# EAGLE board Chronos_DaughterBoard (EAGLE 9.7.0)
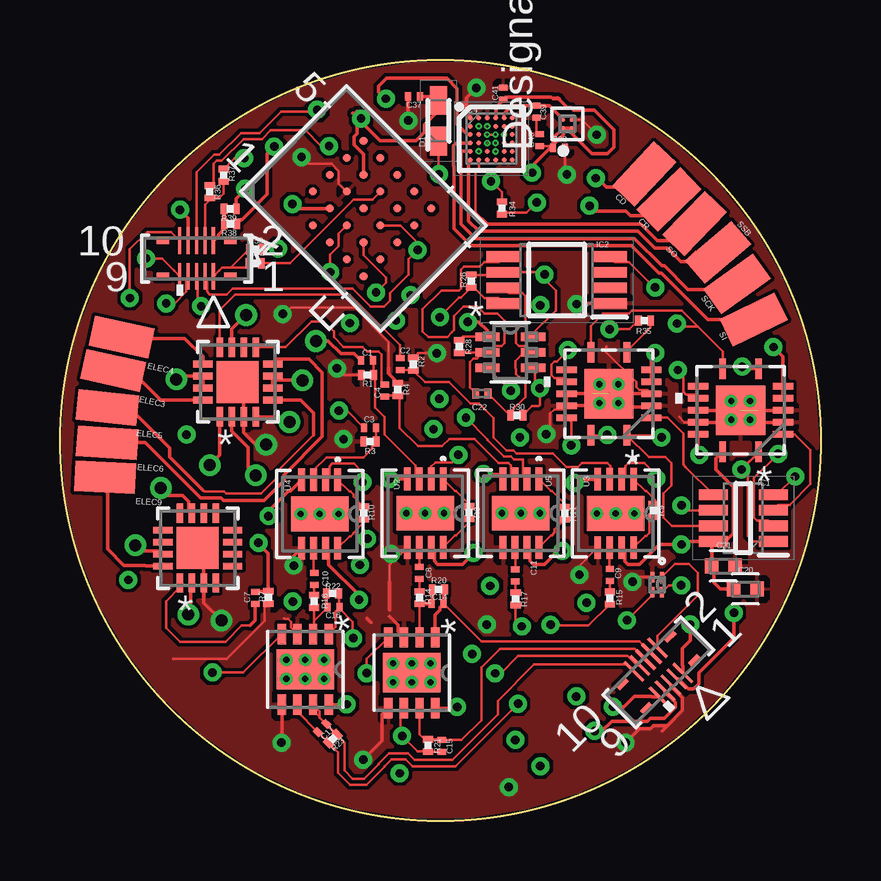
[diagram p5: board, top side]
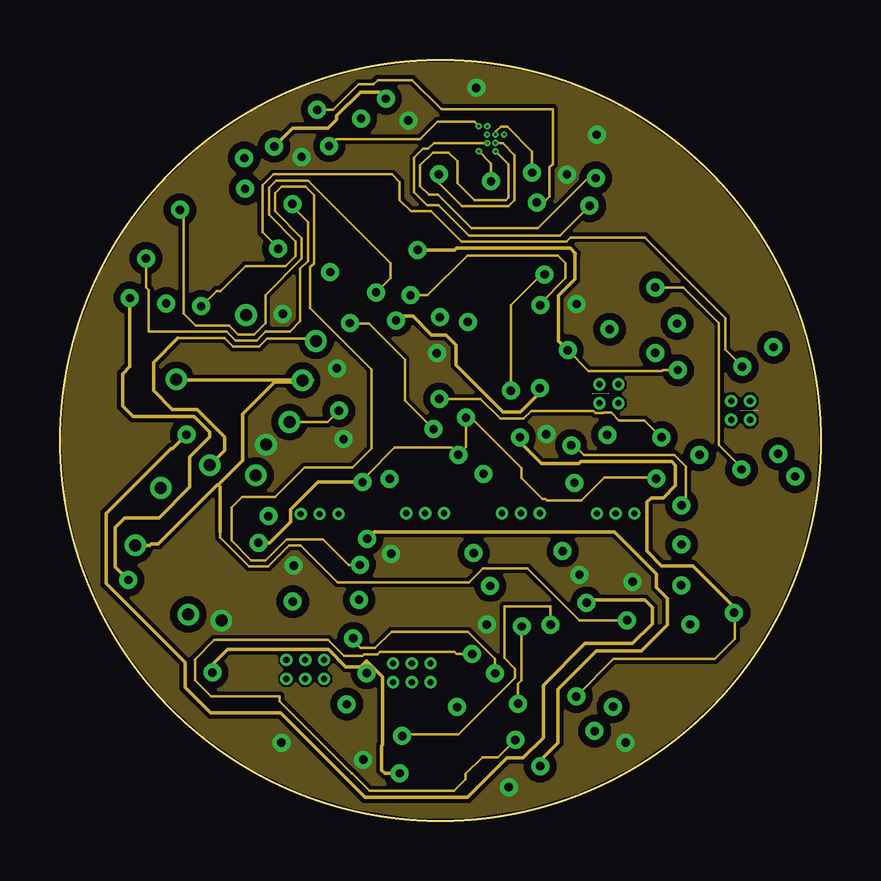
[diagram p6: board, inner layer Route2]
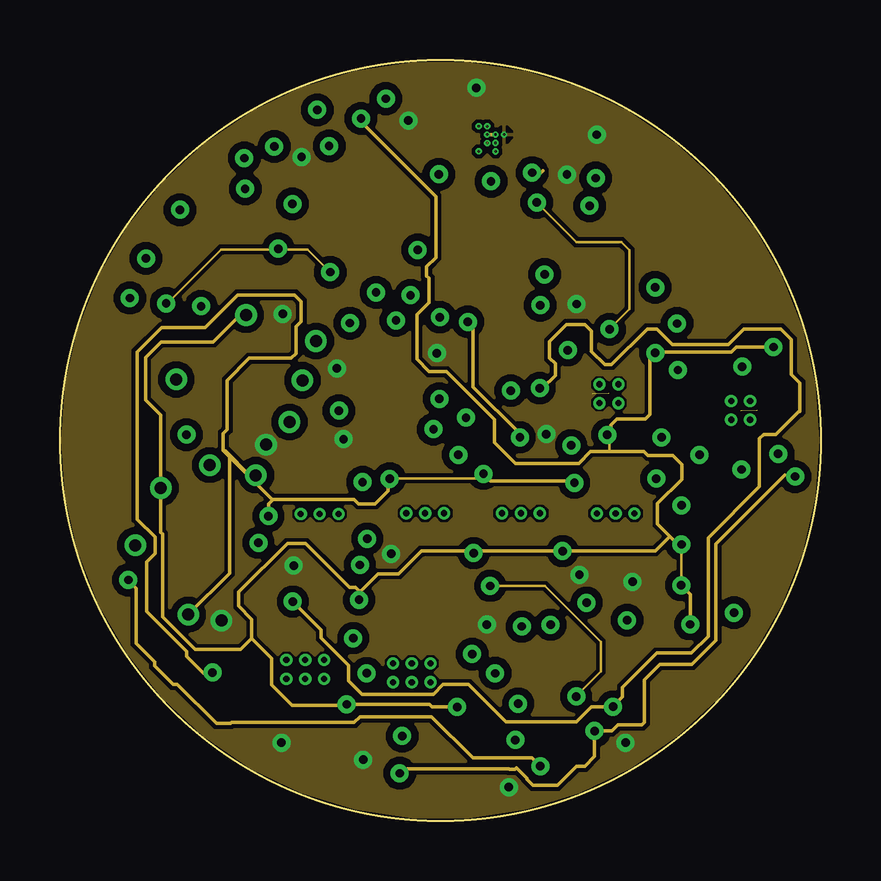
[diagram p7: board, inner layer Route15]
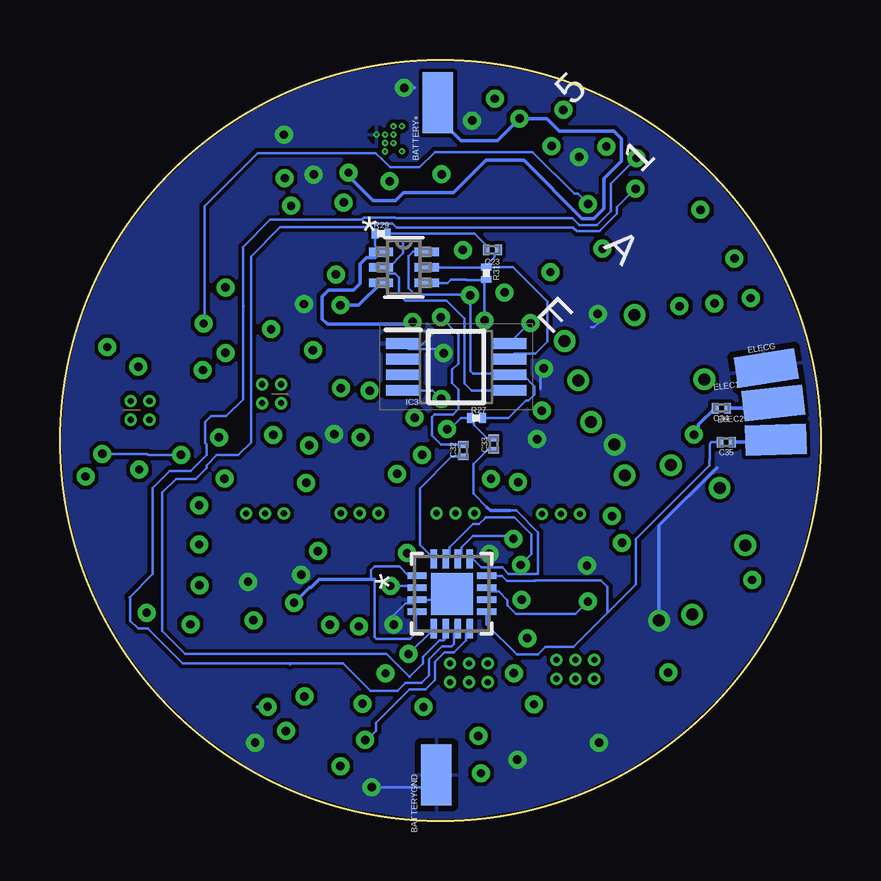
[diagram p8: board, bottom side, seen from below]

Size 31.71 x 31.71 mm. Coordinates in mm from the lower left corner, seen from the top.
Outline: circle at 15.86,15.86 radius 15.86
Copper layers (1+2*15+16): Top / Route2 / Route15 / Bottom
Stack-up 4 Layer Stack: Top SilkScreen Epoxy Ink / Top SolderMask SR:Green 0.0254mm Dk 4.3 / Top Surface Finish Lead-Free 0.02mm / Top CuFoil:007 0.035mm / Dielectric-1 Prepreg:001 0.064mm / Dielectric-2 Prepreg:001 0.064mm / Route2 CuFoil:007 0.035mm / Dielectric-3 Core:066 0.711mm / Route15 CuFoil:007 0.035mm / Dielectric-4 Prepreg:001 0.064mm / Dielectric-5 Prepreg:001 0.064mm / Bottom CuFoil:007 0.035mm / Bottom Surface Finish Lead-Free 0.02mm / Bottom SolderMask SR:Green 0.0254mm Dk 4.3 / Bottom SilkScreen Epoxy Ink
Design rules: minimum copper width 0.05mm, minimum drill size 0.35mm, copper clearance wire_polygon to wire_polygon 6mil, copper clearance wire_polygon to pad_smd 6mil, copper clearance wire_polygon to via 6mil, copper clearance pad_smd to pad_smd 6mil, copper clearance pad_smd to via 6mil, copper clearance via to via 6mil, copper clearance smd to pad (same net) 6mil, copper clearance smd to via (same net) 6mil, copper clearance smd to smd (same net) 6mil, dimension clearance 0.01mm, via restrict clearance 0mil, restrict clearance 0mil, drill distance 6mil, keepout clearance 0mil

## Footprints (pad centres in the part's own frame; a part is rotated, then mirrored left to right if it is on the bottom)
SMD1,27-2,54 = smd 1.27 x 2.54: 1 0,0
C0201 = smd 0.25 x 0.35: 1 -0.25,0; 2 0.25,0
CAPC1005X60 = smd 0.56 x 0.629: 1 -0.485,0; 2 0.485,0
RESC0201_L = smd 0.28 x 0.43: 1 -0.255,0; 2 0.255,0
DIOM179X85N = smd 1.2 x 0.7: 1 -0.85,0; 2 0.85,0
SOT65P280X145-8N = smd 1.2 x 0.45: 1 -1.25,0.975; 2 -1.25,0.325; 3 -1.25,-0.325; 4 -1.25,-0.975; 5 1.25,-0.975; 6 1.25,-0.325; 7 1.25,0.325; 8 1.25,0.975
SOP65P490X110-8N = smd 1.425 x 0.45: 1 -2.212,0.975; 2 -2.212,0.325; 3 -2.212,-0.325; 4 -2.212,-0.975; 5 2.212,-0.975; 6 2.212,-0.325; 7 2.212,0.325; 8 2.212,0.975
BGA36C35P6X6_208X208X49 = smd 0.215 x 0.215: A1 -0.875,0.875; A2 -0.525,0.875; A3 -0.175,0.875; A4 0.175,0.875; A5 0.525,0.875; A6 0.875,0.875; B1 -0.875,0.525; B2 -0.525,0.525; B3 -0.175,0.525; B4 0.175,0.525; B5 0.525,0.525; B6 0.875,0.525; C1 -0.875,0.175; C2 -0.525,0.175; C3 -0.175,0.175; C4 0.175,0.175; C5 0.525,0.175; C6 0.875,0.175; D1 -0.875,-0.175; D2 -0.525,-0.175; D3 -0.175,-0.175; D4 0.175,-0.175; D5 0.525,-0.175; D6 0.875,-0.175; E1 -0.875,-0.525; E2 -0.525,-0.525; E3 -0.175,-0.525; E4 0.175,-0.525; E5 0.525,-0.525; E6 0.875,-0.525; F1 -0.875,-0.875; F2 -0.525,-0.875; F3 -0.175,-0.875; F4 0.175,-0.875; F5 0.525,-0.875; F6 0.875,-0.875 | drill 0.1 pad 0.254: P$1 -0.528,0.525; P$2 -0.175,0.522; P$3 -0.177,0.175; P$4 0.171,0.176; P$5 0.527,0.174; P$6 -0.172,-0.174; P$7 0.171,-0.173; P$8 -0.528,-0.523; P$9 0.173,-0.526
CONN10_HIR = smd 0.127 x 1.118: 1 0.7,-0.747; 2 0.7,0.747; 3 0.35,-0.747; 4 0.35,0.747; 5 0,-0.747; 6 0,0.747; 7 -0.35,-0.747; 8 -0.35,0.747; 9 -0.7,-0.747; 10 -0.7,0.747 | smd 0.533 x 0.305: 11 -1.405,0.745; 12 1.405,0.745; 13 -1.405,-0.745; 14 1.405,-0.745
R0201 = smd 0.28 x 0.43: 1 -0.255,0; 2 0.255,0
FBGA24_8X6X1P2_FAB024_INF = smd 0.33 x 0.33: A2 -1,2; A3 0,2; A4 1,2; A5 2,2; B1 -2,1; B2 -1,1; B3 0,1; B4 1,1; B5 2,1; C1 -2,0; C2 -1,0; C3 0,0; C4 1,0; C5 2,0; D1 -2,-1; D2 -1,-1; D3 0,-1; D4 1,-1; D5 2,-1; E1 -2,-2; E2 -1,-2; E3 0,-2; E4 1,-2; E5 2,-2
DRG8_2P4X1P45 = smd 0.95 x 0.28: 1 -1.425,0.75; 2 -1.425,0.25; 3 -1.425,-0.25; 4 -1.425,-0.75; 5 1.425,-0.75; 6 1.425,-0.25; 7 1.425,0.25; 8 1.425,0.75 | smd 1.45 x 2.4: 9 0,0 | drill 0.254 pad 0.508: V 0,-0.787; V_1 0,0; V_2 0,0.787
CP_16_22_ADI = smd 0.275 x 0.805: 1 0.75,1.452; 2 0.25,1.452; 3 -0.25,1.452; 4 -0.75,1.452; 9 -0.75,-1.452; 10 -0.25,-1.452; 11 0.25,-1.452; 12 0.75,-1.452 | smd 0.805 x 0.275: 5 -1.452,0.75; 6 -1.452,0.25; 7 -1.452,-0.25; 8 -1.452,-0.75; 13 1.452,-0.75; 14 1.452,-0.25; 15 1.452,0.25; 16 1.452,0.75 | smd 1.75 x 1.75: HTAB 0,0
DRB8_2P4X1P65 = smd 0.85 x 0.35: 1 -1.475,0.975; 2 -1.475,0.325; 3 -1.475,-0.325; 4 -1.475,-0.975; 5 1.475,-0.975; 6 1.475,-0.325; 7 1.475,0.325; 8 1.475,0.975 | smd 1.65 x 2.4: 9 0,0 | drill 0.254 pad 0.508: V -0.394,-0.787; V_1 -0.394,0; V_2 -0.394,0.787; V_3 0.394,-0.787; V_4 0.394,0; V_5 0.394,0.787
X2SON4XP6XP6_NEX-L = smd 0.432 x 0.152: 1 -0.318,0.2; 2 -0.318,-0.2; 3 0.318,-0.2; 4 0.318,0.2
YCH0004A-IPC_A = smd 0.174 x 0.174: 1 -0.175,0.175; 2 0.175,0.175; 3 -0.175,-0.175; 4 0.175,-0.175
RGY14_2P05X2P05 = smd 0.28 x 0.85: 1 -0.75,1.731; 7 -0.75,-1.731; 8 0.75,-1.731; 14 0.75,1.731 | smd 0.85 x 0.28: 2 -1.769,1; 3 -1.769,0.5; 4 -1.769,0; 5 -1.769,-0.5; 6 -1.769,-1; 9 1.769,-1; 10 1.769,-0.5; 11 1.769,0; 12 1.769,0.5; 13 1.769,1 | smd 2.05 x 2.05: 15 0,0 | drill 0.254 pad 0.508: V -0.394,-0.394; V_1 -0.394,0.394; V_2 0.394,-0.394; V_3 0.394,0.394
SOT-363-6_2P2X1P35_ONS = smd 1.016 x 0.356: 1 -0.953,0.65; 2 -0.953,0; 3 -0.953,-0.65; 4 0.953,-0.65; 5 0.953,0; 6 0.953,0.65

## Placement (x,y rotation side)
BATTERY+  [SMD1,27-2,54]  15.96,29.93 0 bottom
BATTERYGND  [SMD1,27-2,54]  16.02,1.91 0 bottom
C1  470n  [C0201]  12.8,19.19 0 top
C2  470n  [C0201]  14.19,19.03 270 top
C3  470n  [C0201]  12.93,16.38 0 top
C4  470n  [C0201]  13.54,17.92 270 top
C7  [C0201]  8.14,9.28 90 top
C8  1u  [C0201]  14.99,10.34 270 top
C9  1u  [C0201]  22.93,10.24 270 top
C10  1u  [C0201]  10.6,10.09 270 top
C11  1u  [C0201]  18.99,10.22 270 top
C14  56p  [C0201]  15.75,9.05 0 top
C15  56p  [C0201]  15.92,3.12 270 top
C16  56p  [C0201]  11.42,8.9 180 top
C17  56p  [C0201]  10.93,3.87 225 top
C20  1u  [CAPC1005X60]  28.58,9.66 0 top
C21  0.1u  [CAPC1005X60]  27.66,10.62 0 top
C22  10u  [RESC0201_L]  17.59,17.81 180 top
C23  10u  [RESC0201_L]  13.69,23.8 180 bottom
C32  10u  [RESC0201_L]  14.9,15.43 90 bottom
C33  10u  [RESC0201_L]  13.63,15.7 90 bottom
C34  10u  [RESC0201_L]  4.14,17.2 180 bottom
C35  10u  [RESC0201_L]  3.94,15.78 180 bottom
C37  0.1u  [C0201]  14.76,30.19 180 top
C38  1u  [C0201]  20.81,28.05 0 top
C39  1u  [C0201]  19.87,29.56 270 top
C40  0.1u  [C0201]  20.01,28.37 90 top
C41  10u  [C0201]  18.48,30.31 90 top
CD  WIREPADSMD1,27-254  [SMD1,27-2,54]  24.36,26.96 316.7 top
CR  WIREPADSMD1,27-254  [SMD1,27-2,54]  25.39,25.9 314.1 top
D1  CDSU4148  [DIOM179X85N]  15.78,29.18 90 top
ELEC1  [SMD1,27-2,54]  1.98,17.42 276.4 bottom
ELEC2  [SMD1,27-2,54]  1.87,15.88 271.8 bottom
ELEC3  [SMD1,27-2,54]  2.23,18.77 77.5 top
ELEC4  [SMD1,27-2,54]  2.57,20.16 77.7 top
ELEC5  [SMD1,27-2,54]  1.98,17.23 83.9 top
ELEC6  [SMD1,27-2,54]  1.98,15.75 86.1 top
ELEC9  [SMD1,27-2,54]  1.88,14.31 87.2 top
ELECG  [SMD1,27-2,54]  2.27,18.87 279 bottom
IC1  OPA2369AIDCNR  [SOT65P280X145-8N]  28.49,12.62 180 top
IC2  LT1990IMS8-10#PBF  [SOP65P490X110-8N]  20.71,22.54 180 top
IC3  LT1990IMS8-10#PBF  [SOP65P490X110-8N]  15.2,18.92 0 bottom
IC4  ICE5LP4K-SWG36ITR1K  [BGA36C35P6X6_208X208X49]  17.99,28.43 0 top
J1  BM28B0.6-10DS/2-0.35V(51)CONN10_HIR  [CONN10_HIR]  24.95,6.19 45 top
J2  BM28B0.6-10DS/2-0.35V(51)CONN10_HIR  [CONN10_HIR]  5.7,23.44 0 top
R1  100k  [R0201]  12.82,18.58 0 top
R2  100k  [R0201]  14.73,19.03 270 top
R3  100k  [R0201]  12.93,15.81 0 top
R4  100k  [R0201]  14.08,17.97 270 top
R7  [R0201]  8.69,9.31 90 top
R8  1.4k  [R0201]  17.06,12.85 270 top
R9  1.4k  [R0201]  24.74,12.93 270 top
R10  1.4k  [R0201]  12.67,12.83 270 top
R11  1.4k  [R0201]  21.05,12.82 270 top
R14  2.7k  [R0201]  14.99,9.3 270 top
R15  2.7k  [R0201]  22.93,9.28 270 top
R16  2.7k  [R0201]  10.6,9.15 270 top
R17  2.7k  [R0201]  19,9.25 270 top
R20  1k  [R0201]  15.78,9.64 0 top
R21  1k  [R0201]  15.35,3.14 270 top
R22  1k  [R0201]  11.36,9.48 0 top
R23  1k  [R0201]  11.38,3.42 225 top
R26  100  [R0201]  17.15,22.5 90 top
R27  100  [R0201]  14.36,16.79 0 bottom
R28  1k  [R0201]  16.65,19.77 270 top
R29  1k  [R0201]  18.33,24.48 0 bottom
R30  1k  [R0201]  19.05,16.9 0 top
R31  1k  [R0201]  13.94,22.83 270 bottom
R32  0  [R0201]  8.14,23.24 0 top
R33  0  [R0201]  8.15,23.82 0 top
R34  0  [R0201]  18.43,25.54 270 top
R35  0  [R0201]  24.37,20.85 180 top
R36  0  [R0201]  6.24,26.22 270 top
R37  0  [R0201]  6.83,26.91 270 top
R38  0  [R0201]  7.11,24.88 180 top
R39  0  [R0201]  7.1,25.51 180 top
SCK  WIREPADSMD1,27-254  [SMD1,27-2,54]  28.23,22.38 305.6 top
SI  WIREPADSMD1,27-254  [SMD1,27-2,54]  28.92,20.89 295.8 top
SO  WIREPADSMD1,27-254  [SMD1,27-2,54]  26.46,24.9 316.1 top
SSB  WIREPADSMD1,27-254  [SMD1,27-2,54]  27.44,23.69 310.5 top
U1  CY15B116QSN-108BKXIFBGA24_8X6X1P2_FAB024_INF  [FBGA24_8X6X1P2_FAB024_INF]  12.66,25.52 45 top
U2  INA333AIDRGRDRG8_2P4X1P45  [DRG8_2P4X1P45]  15.23,12.82 270 top
U3  INA333AIDRGRDRG8_2P4X1P45  [DRG8_2P4X1P45]  23.17,12.81 270 top
U4  INA333AIDRGRDRG8_2P4X1P45  [DRG8_2P4X1P45]  10.83,12.79 270 top
U5  INA333AIDRGRDRG8_2P4X1P45  [DRG8_2P4X1P45]  19.22,12.82 270 top
U6  ADG4612BCPZ-REEL7CP_16_22_ADI  [CP_16_22_ADI]  5.75,11.37 180 top
U8  OPA2314AIDRBRDRB8_2P4X1P65  [DRB8_2P4X1P65]  14.67,6.17 270 top
U9  OPA2314AIDRBRDRB8_2P4X1P65  [DRB8_2P4X1P65]  10.23,6.31 270 top
U11  ADG4612BCPZ-REEL7CP_16_22_ADI  [CP_16_22_ADI]  7.42,18.29 180 top
U13  74LVC1G14GX4ZX2SON4XP6XP6_NEX-L  [X2SON4XP6XP6_NEX-L]  24.9,9.84 270 top
U14  TPS7A0212PYCHRYCH0004A-IPC_A  [YCH0004A-IPC_A]  21.16,29.05 90 top
U15  DAC8832ICRGYTRGY14_2P05X2P05  [RGY14_2P05X2P05]  28.38,17.11 180 top
U16  DAC8832ICRGYTRGY14_2P05X2P05  [RGY14_2P05X2P05]  22.89,17.8 180 top
U17  MBT3946DW1T1GSOT-363-6_2P2X1P35_ONS  [SOT-363-6_2P2X1P35_ONS]  18.78,19.53 0 top
U18  MBT3946DW1T1GSOT-363-6_2P2X1P35_ONS  [SOT-363-6_2P2X1P35_ONS]  17.38,23.07 0 bottom
U19  ADG4612BCPZ-REEL7CP_16_22_ADI  [CP_16_22_ADI]  15.38,9.46 90 bottom

## Tracks (layer width: path | path; a pad name or v marks a point on that pad's centre or on a via)
+1.2V
  Top 0.152: U14.2 20.4,29.81 C39.1 18.85,29.8 18.51,29.47 IC4.A5
CDONE  (via drill 0.35)  (1 unrouted)
  Top 0.152: CD.1 24.36,26.93 23.84,26.41 22.79,26.41 22.41,26.79 v22.34,26.79
  Route2 0.102: v22.34,26.79 22.02,26.79 19.94,24.71 17.16,24.71 15.76,26.11 15.38,26.11 15.02,26.46 15.02,27.32 15.55,27.85 16.21,27.85 16.57,27.49 16.57,26.59 17.28,25.88 18.59,25.88 18.7,25.98 18.7,27.36 IC4.P$9
CRST  (via drill 0.35)  (1 unrouted)
  Top 0.152: CR.1 24.72,25.23 23.78,25.23 23.6,25.41 22.3,25.41 v22.08,25.63
  Route2 0.102: IC4.P$6 15.59,28.25 15.35,28.01 15.14,28.01 14.77,27.64 14.77,26.2 15.29,25.67 15.78,25.67 17.06,24.4 20.85,24.4 v22.08,25.63
CS_QSPI  (via drill 0.35)
  Top 0.102: J2.7 5.26,22.61 5.26,22.05 4.78,21.56 v4.43,21.56 | U1.C2 11.61,24.47 11.61,23.95 11.26,23.6 v11.26,22.87
  Route15 0.102: v4.43,21.56 4.47,21.56 6.73,23.82 10.31,23.82 v11.26,22.87
GND  (via drill 0.35, 0.5)  (3 unrouted)
  Top 0.102: U13.2 24.17,10.15 23.97,9.96 v23.87,9.96 | U1.B3 11.61,26.56 11.61,27.08 11.31,27.38 10.36,27.38 v10.07,27.67 | C40.2 19.87,28.76 C39.2 | U14.4 21.75,29.22 v22.38,28.6 | U16.4 24.5,17.95 24.15,17.95 24.03,18.07 24.03,18.28 22.79,19.53 22.79,19.76 | U16.12 20.96,17.14 20.61,17.14 20.44,16.97 20.44,16.27 v20.28,16.11 | v11.54,18.85 11.82,18.58 R1.1 | 13.69,18.88 13.69,19.96 12.27,21.38 9.64,21.38 9.39,21.12 v9.29,21.12 | U9.3 9.63,8.05 9.63,8.29 9.51,8.41 9.36,8.41 9.34,8.43 | R7.1 8.52,8.89 8.52,8.33 6.95,6.75 5.74,6.75 | 5.74,6.75 | 5.74,6.75 4.72,6.75 | U3.5 21.53,10.49 21.53,10.37 v21.66,10.25 | 13.74,8.79 13.74,10.65 U2.5 14.21,11.13 v13.81,11.13 | C38.2 21.06,27.02 v21.14,26.94 | v21.54,21.54 21.57,21.56 IC2.1 | 25.82,16.82 26.03,16.61 U15.12 | v15.72,19.49 14.93,19.49 R2.1
  Top 0.152: U11.HTAB 7.67,18.04 U11.3 7.67,16.17 8.16,15.68 v8.6,15.68 | U6.HTAB 6,11.12 U6.3 6,9.08 v6.74,8.34 | R4.1 13.94,18.37 13.94,18.39 13.69,18.64 13.69,18.88 | 16.96,29.46 IC4.A1 | 16.96,29.46 16.86,29.55 16.86,29.94 | 16.96,29.46 16.96,30.14 v17.36,30.55 | C37.2 14.51,29.2 v14.53,29.18 | U15.4 29.07,17.11 29.06,17.11 | U15.3 29.28,16.61 29.25,16.58 | U15.11 27.69,17.11 27.69,17.1 | U15.12 27.41,16.61 27.68,16.34 | 22.2,17.79 22.2,17.8 U16.11 U16.12 21.92,17.3 22.15,17.07 | 23.57,17.8 U16.4 | U16.3 24.6,17.24 23.8,17.24 23.66,17.1 | U9.5 9.25,3.26 v9.24,3.25 | J1.5 25.47,5.59 25.95,5.12 25.95,4.59 25.32,3.96 | 25.32,3.96 25.11,3.75 | 25.32,3.96 24.74,3.96 24.62,3.84 24.17,3.84 v23.58,3.25 | U8.3 14.1,7.89 14.1,8.16 13.74,8.52 | 13.74,8.79 13.74,9.96 | U8.5 13.43,4.43 13.43,3.32 v12.64,2.54 | 12.81,8.42 12.96,8.27 | U4.5 9.74,11.03 v9.74,10.63
  Bottom 0.102: 9.56,20.58 9.45,20.58 9.27,20.75 9.27,21.11 v9.29,21.12 | IC3.1 17.19,19.67 15.9,19.67 v15.72,19.49 | v11.54,18.85 11.67,18.73 11.67,18 | 14.81,8.85 14.81,8.89 U19.HTAB 15.63,9.21 U19.3 16.99,9.05 17.32,9.05 17.8,8.57 v17.8,8.18 | BATTERYGND.1 16.54,1.39 18.66,1.39 18.67,1.39 v18.72,1.39 | v23.87,9.96 23.77,9.86 23.57,9.86 | v13.81,11.13 13.87,11.13 13.97,11.02 | 20.35,16.12 v20.28,16.12 v20.28,16.11
  Bottom 0.152: v17.36,30.55 16.96,30.55 16.94,30.57 | v8.6,15.68 8.57,15.68 | 9.6,10.36 9.73,10.5 9.73,10.62 v9.74,10.63 | 4.34,14.71 6.74,12.31 v6.74,8.34
  other vias: 11.82,15.9
  pour Top: -5.27,34.07 32.31,34.07 32.31,-1.21 -5.46,-1.21 -5.46,34.09 -5.34,34.09
  pour Bottom: -6.25,34.93 33.1,34.93 33.1,-2.07 -6.06,-2.07 -6.06,34.93
  pour Route2: -7.23,34.8 33.55,34.8 33.55,-2.91 -7.23,-2.91
  pour Route15: -9.11,35.88 34.4,35.88 34.4,-3.99 -9.28,-3.99 -9.28,35.89 -9.05,35.89
GPIO1  (via drill 0.35)
  Top 0.102: J2.6 5.7,27.04 6.42,27.76 6.64,27.76 7.55,28.67 8.32,28.67 9.22,29.57 10.66,29.57 v10.73,29.63 | R34.2 18.48,25.34 19.44,25.34 v19.88,25.77 | v22.91,20.48 23.75,20.48 R35.2
  Route2 0.102: v19.88,25.77 20.16,25.77 20.41,26.02 20.41,27.24 20.55,27.38 20.55,29.66 15.9,29.66 14.68,30.88 13.26,30.88 13.08,30.7 12.45,30.7 11.38,29.63 v10.73,29.63
  Route15 0.102: 23.41,24.13 23.41,24.12 | 23.41,24.12 23.75,23.79 23.75,21.32 v22.91,20.48 | 23.41,24.12 21.53,24.12 v19.88,25.77
GPIO2
  Top 0.102: J2.4 6.05,25.67 6.34,25.96 | R37.2 6.83,26.13 6.66,25.96 6.38,25.96 | 6.47,26.05 6.38,25.96 | 6.38,25.96 6.34,25.96 | 6.34,25.96 R36.2
GPIO3
  Top 0.152: J2.2 6.61,24.39 6.61,24.43 6.85,24.67 R38.2 6.85,25.5 R39.2
HCS1  (via drill 0.35)
  Top 0.152: v5.01,25.47 5.35,25.13 J2.8
  Route2 0.102: v5.01,25.47 5.16,25.32 5.16,21.15 5.66,20.65 7.06,20.65 7.43,20.27 8.09,20.27 8.56,20.75 8.56,21.91 10.08,23.43 10.08,24.29 8.96,25.4 8.96,26.16 9.24,26.43 10.24,26.43 10.59,26.08 10.59,23.22 10.44,23.07 10.44,21.37 12.99,18.82 12.99,15.51 12.2,14.73 10.2,14.73 8.97,13.5 7.6,13.5 7.15,13.05 7.15,11.68 7.98,10.86 8.58,10.86 9.45,11.73 10.97,11.73 12.04,10.66 v12.5,10.66
  Bottom 0.102: U19.15 15.47,11.07 15.47,11.4 14.5,12.36 14.25,12.36 13.98,12.63 13.98,12.65 12.77,12.65 12.05,11.93 12.05,11.11 v12.5,10.66
HCS2  (via drill 0.35)
  Top 0.102: J2.10 | J2.10 4.64,24.54 3.63,24.54 2.92,23.83 2.92,21.86
  Top 0.152: v2.92,21.79 2.92,21.86
  Route2 0.152: v2.92,21.79 2.92,18.94 2.61,18.63 2.61,17.29 3.05,16.84 5.59,16.84 6.24,16.2 6.24,15.98 5.42,15.16 5.42,13.91 4.13,12.62 2.7,12.62 2.31,12.23 2.31,10.58 v2.85,10.04 | v20.02,2.27 20.02,2.51 20.76,3.25 20.76,5.48 22.36,7.08 24.25,7.08 25.33,8.16 25.33,9.27 24.87,9.73 24.87,10.28 23.11,12.03 13.08,12.03 v12.81,11.75
  Route15 0.152: v20.02,2.27 19.68,2.61 17.21,2.61 15.49,4.33 12.5,4.33 12.27,4.1 7.16,4.1 7.11,4.05 6.53,4.05 4.89,5.69 4.72,5.69 3.96,6.45 3.96,6.63 3.19,7.4 3.19,9.68 2.85,10.02 v2.85,10.04
  Bottom 0.102: U19.14 14.97,11.07 14.97,11.4 14.5,11.86 12.92,11.86 v12.81,11.75
HCS3  (via drill 0.35)
  Top 0.102: v7.68,27.62 7.28,27.62 R37.1
  Route2 0.102: v7.68,27.62 7.64,27.62 7.57,27.7
  Bottom 0.102: U19.7 15.29,7.84 15.29,7.37 15.39,7.27 15.79,7.27 16.33,6.73 16.33,6.07 16.65,5.75 17.3,5.75 17.65,5.41 18.76,5.41 19.92,6.57 22.08,6.57 | 22.08,6.57 22.13,6.52 | 22.08,6.57 26.61,6.57 28.05,8.01 28.45,8.01 28.78,8.34 28.78,9.28 28.82,9.32 27.85,10.29 27.85,13.87 27.14,14.58 26.27,14.58 25.61,15.24 25.61,15.69 25.66,15.74 25.66,16.62 25.42,16.87 24.78,16.87 24.09,17.56 24.09,21.41 | 24.05,21.45 24.09,21.41 | 24.09,21.41 24.09,23.92 22.96,25.05 19.14,25.05 19.03,25.15 17.74,25.15 17.71,25.12 10.35,25.12 10.06,24.82 9.33,24.82 8.75,25.4 8.75,26.56 v7.68,27.62
HCS4  (via drill 0.35)
  Top 0.152: R39.1 7.35,25.93 7.72,26.3 v7.72,26.34
  Bottom 0.102: v7.72,26.34 8.49,25.57 8.49,25.3 9.22,24.57 10.16,24.57 10.33,24.73 17.68,24.73 17.85,24.89 18.81,24.89 18.96,24.74 22.53,24.74 23.75,23.52 23.75,15.77 24.28,15.24 25.18,15.24 25.61,14.81 25.61,14.71 26.07,14.25 26.88,14.25 27.45,13.68 27.45,7.91 26.5,6.96 18.09,6.96 17.14,6 16.58,6.56 16.58,6.84 15.9,7.53 15.73,7.53 15.63,7.63 U19.6
HCSOUT1  (via drill 0.35)
  Top 0.102: 19.97,22.77 20.1,22.64 20.13,22.64 20.67,22.1 20.67,21.27 19.73,20.32 U17.6 | 19.97,22.77 19.88,22.86 IC2.6 18.38,22.75 R26.2 | 19.97,22.77 v20.21,22.77 | U17.3 18.77,17.93 v18.8,17.93
  Route2 0.102: v20.21,22.77 20.07,22.77 18.8,21.5 v18.8,17.93
HCSOUT2  (via drill 0.35)
  Route2 0.102: v20.02,21.49 20.02,21.56 21.08,22.61 21.08,23.25 20.76,23.57 16.99,23.57 15.32,21.9 v14.62,21.9
  Bottom 0.102: R27.2 13.02,16.79 12.29,17.51 12.19,17.51 11.93,17.77 11.93,18.11 12.41,18.59 IC3.6 13.04,18.65 14.49,18.65 14.59,18.75 14.59,21.49 14.88,21.78 | U18.6 16.99,23.72 17.18,23.53 17.18,22.2 16.92,21.94 15.04,21.94 14.88,21.78 | 14.88,21.78 14.77,21.9 14.62,21.9 v14.62,21.9
  Bottom 0.152: U18.3 19.26,21.49 v20.02,21.49
ICE_SCK
  Top 0.152: IC4.E1 16.71,27.9 16.71,27.41 16.72,27.39 16.72,24.88 17.33,24.27 23.95,24.27 25.09,23.13 25.19,23.13 26.18,22.15 27.08,22.15 27.3,22.38 SCK.1
ICE_SI
  Top 0.152: IC4.D1 16.52,28.25 16.41,28.14 16.41,27.28 16.42,27.27 16.42,26.65 | 16.42,26.65 16.42,24.68 17.14,23.97 23.83,23.97 24.96,22.83 25.06,22.83 27,20.89 27.56,20.89 27.62,20.88 27.64,20.89 SI.1 | 16.42,26.65 16.42,26.63
ICE_SO
  Top 0.102: IC4.F2 17.46,27.13 17.32,26.99 17.32,25.38 17.62,25.08
  Top 0.152: SO.1 25.75,24.19 24.92,24.19 24.22,24.88 17.81,24.88 17.62,25.08
ICE_SS_B
  Top 0.152: SSB.1 26.51,23.69 26.13,23.31 25.88,23.31 25.33,23.87 24.8,23.87 24.09,24.57 17.46,24.57 17.04,25 17.04,27.48 IC4.F1
INV1  (via drill 0.35)
  Top 0.102: IC1.2 29.51,12.51 29.05,12.51 28.93,12.63 28.93,14.28 v29.94,15.29 | v26.67,15.25 26.61,15.31 U15.13
  Bottom 0.102: v26.67,15.25 28.04,15.25 28.08,15.29 v29.94,15.29
INV2  (via drill 0.35)
  Top 0.102: v25.91,13.15 26.12,12.94 IC1.6 | U16.13 21.32,16.59 v21.32,15.65
  Route2 0.102: v25.91,13.15 26.1,13.34 26.1,14.77 25.62,15.25 21.84,15.25 21.45,15.65 v21.32,15.65
IOB_29B  (via drill 0.35)  (1 unrouted)
  Top 0.102: R34.1 18.43,26.2 v17.97,26.65
  Route2 0.102: IC4.P$8 17.97,27.39 v17.97,26.65
IOB_30A  (via drill 0.35)
  Top 0.152: R38.1 7.55,25.06 7.59,25.06 8.64,26.11 8.64,27.81 v8.93,28.1 | IC4.C1 16.97,28.62 16.56,29.03 16.56,30.52 16.13,30.95 13.62,30.95 13.29,30.62 13.29,30.38 13.56,30.1 v13.58,30.1
  Route2 0.152: v13.58,30.1 13.31,30.38 12.52,30.38 11.53,29.38 11.53,29.23 11.17,28.88 9.71,28.88 v8.93,28.1
IOB_31B  (via drill 0.35)  (1 unrouted)
  Top 0.102: R36.1 6.41,26.64 6.41,27.39 6.53,27.51 6.75,27.51 7.66,28.41 8.42,28.41 8.79,28.78 10.24,28.78 10.89,28.12 v11.22,28.12
  Route2 0.102: IC4.P$1 17.27,29.14 15.75,29.14 15.02,28.41 11.5,28.41 v11.22,28.12
IOSTIMGLITCH
  Top 0.102: U13.1 25.64,10.7 26.23,10.7 26.59,10.34 26.59,9.38 24.91,7.71 J1.2
IOUT1  (via drill 0.35)
  Top 0.102: IC2.8 18.27,21.78 17.7,21.78 17.24,22.24 R26.1 16.72,21.81 16.63,21.81 15.83,21.01 v15.83,20.99
  Bottom 0.102: C32.2 15.82,15.68 16.2,16.06 16.2,16.83 16.1,16.93 15.34,16.93 15.11,17.16 15.11,17.98 15.37,18.24 15.37,18.8 15.1,19.07 15.1,20.25 v15.83,20.99
IOUT2  (via drill 0.35)
  Route2 0.102: v15.57,16.32 14.38,17.51 14.38,19.23 12.89,20.71 12.12,20.71 v12.09,20.74
  Bottom 0.102: v15.57,16.32 15.45,16.32 14.98,16.79 R27.1 14.44,16.62 14.44,16.49 13.91,15.95 C33.2 | IC3.8 12.16,20.71 12.12,20.71 v12.09,20.74
N$1
  Top 0.102: C1.2 13.07,19.16 R1.2 13.14,18.51 13.14,17.22 13.53,16.83 13.53,16.09 14.82,14.8 14.82,14.4 U2.3
N$2
  Top 0.102: U2.8 16.47,11.89 16.51,11.89 17.06,12.43 R8.2
N$3  (1 unrouted)
N$5
  Top 0.102: C4.2 13.58,17.72 R4.2 14.17,17.63 14.17,16.37 14.92,15.62 15.93,15.62 16.23,15.92 17.28,15.92 18.28,14.92 18.69,14.92 18.81,14.8 18.81,14.4 U5.3 18.97,14.64
N$6
  Top 0.102: C3.2 R3.2 13.01,15.64 13.01,15.51 12.65,15.14 11.11,15.14 10.58,14.61 U4.3
N$7
  Top 0.102: C2.2 R2.2 15.22,18.28 16.22,18.28 17.11,17.39 17.47,17.39 18.08,16.79 18.08,15.97 18.62,15.43 18.9,15.43 19.03,15.3 20.56,15.3 21.11,14.75 21.59,14.75 21.75,14.92 22.82,14.92 22.95,14.79 22.95,14.26 U3.3
N$8
  Top 0.102: U2.1 16.47,13.74 16.51,13.74 17.06,13.2 R8.1
N$9
  Top 0.102: R9.1 24.81,13.25 24.81,13.38 24.45,13.73 24.41,13.73 U3.1
N$10
  Top 0.102: R9.2 24.57,12.5 24.57,12 24.45,11.88 24.41,11.88 U3.8
N$11
  Top 0.102: U4.8 12.07,11.86 12.11,11.86 12.23,11.98 12.23,11.99 12.67,12.43 R10.2
N$12
  Top 0.102: R10.1 12.23,13.52 12.23,13.6 12.11,13.71 12.07,13.71 U4.1
N$13
  Top 0.102: U5.1 20.46,13.74 20.5,13.74 21.05,13.2 R11.1
N$14
  Top 0.102: R11.2 20.62,12.13 20.62,12.01 20.5,11.89 20.46,11.89 U5.8
N$19
  Top 0.102: U2.6 C8.1
N$20
  Top 0.102: C8.2 R14.1
N$21
  Top 0.102: C9.1 U3.6
N$22
  Top 0.102: R15.1 C9.2
N$23
  Top 0.102: U4.6 10.58,10.36 C10.1
N$24
  Top 0.102: R16.1 C10.2
N$25
  Top 0.102: U5.6 18.99,11.37 C11.1
N$26
  Top 0.102: C11.2 R17.1
N$31
  Top 0.102: R14.2 U8.2 | 15.52,9.52 R20.1
  Top 0.152: 15.52,9.52 15.52,9.07 C14.1 R14.2
N$32  (via drill 0.35)
  Top 0.102: R15.2 22.04,8.14 20.46,8.14 v20.46,8.17 | U8.6 14.21,4.56 14.21,3.58 | C15.2 15.36,2.87 R21.2 14.9,2.88 14.21,3.58 | 14.21,3.58 14.22,3.58 v14.27,3.53
  Route2 0.102: v20.46,8.17 20.46,8.93 18.52,8.93 18.52,6.79 18.98,6.34 18.98,5.95 16.63,3.6 14.34,3.6 v14.27,3.53
N$33  (via drill 0.35)
  Top 0.102: 10.75,3.71 9.88,4.58 9.88,4.81 U9.6 9.9,4.54 C17.2 | R23.2 C17.2 10.75,3.71 | 10.75,3.71 11.6,2.85 11.6,1.99 12.09,1.5 12.78,1.5 13.53,2.24 13.53,2.26 13.82,2.55 14.4,2.55 14.69,2.27 16.5,2.27 v19.1,4.87 | R17.2 19,8.35 v19.25,8.1
  Route2 0.102: v19.1,4.87 19.1,5.71 19.23,5.84 19.23,8.07 v19.25,8.1
N$34
  Top 0.102: 10.6,8.33 R16.2 | U9.2 10.6,7.83 10.6,8.33 | 10.6,8.33 C16.2 11.1,8.96 R22.1
N$37  (via drill 0.35)  (1 unrouted)
  Top 0.102: D1.1 15.78,26.97 v15.8,26.95
  Route2 0.102: 18.47,28.24 | 18.47,28.24 18.17,28.24 IC4.P$7 | v15.8,26.95 15.8,26.58 16.76,25.62 18.7,25.62 18.95,25.88 18.95,27.75 18.47,28.24
N$38
  Top 0.102: R32.2 9.6,23.24 12.24,25.88 13.02,25.88 U1.C4
N$39
  Bottom 0.102: C32.1 15.39,15.17 16.71,13.86 16.71,11.49 U19.16
N$40
  Bottom 0.102: C33.1 13.91,15.44 14.48,14.88 14.48,13.64 13.91,13.07 | 12.96,12.93 12.69,12.93 11.78,12.02 11.78,10.28 13.01,10.28 13.27,10.55 14.14,10.55 14.5,10.91 U19.13
  Bottom 0.152: 13.91,13.07 13.77,12.93 12.96,12.93
N$41  (via drill 0.35)
  Route2 0.102: v17.18,6.94 16.54,6.94 16.45,7.03 13.34,7.03 13.25,6.94 12.67,6.94 12.61,6.87 11.84,6.87 11.18,7.54 6.44,7.54 5.63,6.73 5.63,5.86 6.3,5.19 9.16,5.19 9.16,4.98 12.16,1.98 12.18,1.98 12.91,1.25 16.44,1.25 16.92,1.73 16.92,1.95 17.61,2.64 18.26,2.64 v18.99,3.37
  Bottom 0.102: U19.8 14.79,7.84 14.79,7.52 15.28,7.02 15.69,7.02 16.08,6.63 16.08,5.87 16.47,5.48 17.15,5.48 18.54,4.09 18.54,3.74 18.91,3.37 v18.99,3.37 | v17.18,6.94 v17.18,6.95 U19.5
N$42
  Bottom 0.152: C34.1 2.2,17.2 ELEC1.1
N$43
  Bottom 0.152: C35.1 1.97,15.78 ELEC2.1
N$44  (via drill 0.35)
  Top 0.102: R33.2 8.42,23.84 v9.1,23.84 | U15.7 28.53,18.84 v28.44,18.93
  Route2 0.102: v9.1,23.84 9.1,23.88 8.45,24.53 8.45,26.49 8.9,26.94 13.84,26.94 14.17,26.62 14.17,25.88 14.63,25.42 15.47,25.42 16.74,24.14 21.11,24.14 21.29,24.32 24.38,24.32 27.73,20.96 27.73,19.64 v28.44,18.93
NPNBASE1
  Top 0.102: 17.65,19.51 R28.2 | 17.65,19.51 17.81,19.51 U17.2 18.09,19.8 18.42,19.8 18.54,19.91 18.54,20.84 18.25,21.13 17.7,21.13 17.4,21.43 16.83,21.43 16.43,21.03 16.43,20.45 16.35,20.36 16.15,20.17 15.36,20.17 15.12,20.4 15.12,21.32 15.9,22.1 16.65,22.1 16.73,22.18 16.73,22.98 16.85,23.1 17.5,23.1 17.7,23.29 18.27,23.29 IC2.5 | C22.2 17.09,18.05 17.09,19.11 17.23,19.26 17.39,19.26 17.65,19.51
NPNBASE2
  Bottom 0.102: IC3.5 14.56,17.94 14.84,18.22 14.84,20.93 15.59,21.68 17.32,21.68 17.58,21.94 17.58,22.64 17.74,22.8 18.06,22.8 U18.2 18,23.07 17.41,23.66 17.41,24.13 17.53,24.25 17.84,24.25 R29.2 14.44,24.48 13.94,23.98 C23.2
OUT1
  Top 0.102: C14.2 17.57,7.48 24.15,7.48 J1.4
  Top 0.152: R20.2 16,9.6 C14.2 15.85,8.9 15.85,8.78 15.64,8.57 U8.1
OUT2
  Top 0.102: J1.6 23.98,7.16 18.34,7.16 17.56,6.38 17.56,4.18 16.75,3.37 C15.1 | U8.7 14.99,3.6 15.23,3.37 C15.1 | R21.1 15.89,3.39 C15.1
OUT3  (via drill 0.35)
  Top 0.102: 11.63,8.86 C16.1 11.49,8.72 11.49,8.07 U9.1 | 11.63,8.86 11.63,9.38 11.53,9.48 R22.2 | J1.8 24.05,6.47 23.66,6.86 19.1,6.86 18.38,6.14 v18.14,6.14 | 11.63,8.86 12.21,8.28 12.21,7.62 v12.23,7.6
  Route2 0.102: v18.14,6.14 18.14,6.75 17.02,7.87 13.82,7.87 13.14,7.19 12.54,7.19 12.23,7.51 v12.23,7.6
OUT4
  Top 0.102: U9.7 10.58,4.81 | 10.58,4.81 10.82,4.56 10.82,4.28 11.86,3.25 11.86,2.09 12.2,1.75 12.68,1.75 13.27,2.35 13.27,2.37 13.71,2.81 14.51,2.81 14.78,2.54 16.37,2.54 18.27,4.44 18.27,5 19.77,6.51 23.64,6.51 J1.10 | 10.58,4.81 10.58,4.57 C17.1 R23.1
PNPBASE
  Top 0.102: IC2.7 18.72,21.99 19.29,21.99 19.41,21.87 19.41,20.83 19.02,20.44 19.02,19.91 19.14,19.8 19.46,19.8 U17.5 19.35,19.53 18.99,19.17 18.99,18.87 19.02,18.84 19.02,18.61 19.14,18.5 19.16,18.5 19.4,18.26 19.4,17.66 18.79,17.05 R30.1 | R30.1 | C22.1 18.74,16.91 R30.1
PNPBASE2
  Bottom 0.102: IC3.7 12.76,19.46 11.89,19.46 11.38,19.97 11.38,21.64 12.82,23.08 R31.1 | U18.5 14.21,23.07 14.01,23.07 13.95,23.07 R31.1 | C23.1 13.6,23.63 13.6,23.5 13.94,23.16 R31.1
QSPI1  (via drill 0.35)
  Top 0.102: J2.3 6.13,22.61 6.13,22.05 6.25,21.93 6.95,21.93 7.21,22.19 12.19,22.19 12.94,21.44 13.52,21.44 13.76,21.68 13.76,21.99 14.54,22.77 14.54,23.42 v14.91,23.79 14.95,23.79 14.97,23.81 14.97,24.04 14.19,24.81 U1.D3 | U15.10 26.45,17.76 26.1,17.76 25.98,17.88 25.98,18.57 v25.76,18.78 | U16.10 20.96,18.45 20.61,18.45 20.49,18.57 20.49,19.02 20.61,19.14 20.72,19.14 21.17,19.59 v21.17,19.61
  Route2 0.102: v21.17,19.61 22.04,18.75 25.09,18.75 25.13,18.78 v25.76,18.78
  Route2 0.152: v21.17,19.61 20.79,20 20.79,21.88 21.48,22.57 21.48,23.62 21.5,23.64 21.27,23.86 16.52,23.86 16.45,23.79 v14.91,23.79
QSPI2  (via drill 0.35)
  Top 0.102: J2.5 5.74,22.65 5.74,21.6 v5.88,21.45 | U1.D2 12.66,23.58 13.59,22.65 13.59,22.43 v13.18,22.02
  Route2 0.102: v13.18,22.02 13.79,22.63 13.79,23.24 10.34,26.69 9.01,26.69 8.71,26.39 8.71,25.26 9.83,24.14 9.83,23.54 9.4,23.11 7.73,23.11 6.7,22.09 6.52,22.09 v5.88,21.45
QSPI3
  Top 0.102: R32.1 7.69,23.05 7.12,23.05 | J2.1 6.63,22.92 6.63,22.93 6.75,23.05 7.05,23.05 7.12,23.05 | R33.1 7.12,23.05
QSPI_SCK  (via drill 0.35)
  Top 0.102: J2.9 4.76,22.92 4.76,22.93 4.25,23.44 v3.59,23.44 | U15.8 27.63,19.56 26.59,20.6 | 26.59,20.6 25.92,21.26 23.85,21.26 23.72,21.13 22.65,21.13 22.14,20.62 U16.8 | 26.59,20.6 25.85,20.6 v25.72,20.72
  Top 0.152: U1.B2 10.02,25.52 9.83,25.71 v9.69,25.71
  Route2 0.102: v3.59,23.44 3.59,22.21 3.69,22.11 3.69,20.4 5.55,20.4 5.55,20.39 6.95,20.39 7.32,20.02 8.2,20.02 8.57,20.4 9.59,20.4 10.02,20.82 10.02,23.01 10.34,23.33 10.34,24.96 9.69,25.6 v9.69,25.71
  Bottom 0.102: v25.72,20.72 25.69,20.76 25.69,25.62 23.47,27.84 18.56,27.84 18.3,27.57 18.28,27.57 17.96,27.25 16.72,27.25 16.09,27.88 12.02,27.88 10.27,26.13 10.12,26.13 v9.69,25.71
RECELEC1
  Top 0.152: ELEC3.1 2.97,18.77 4.21,17.54 U11.16
RECELEC2
  Top 0.152: 3.75,20.16 ELEC4.1 2.62,20.11 5.2,20.11 5.96,19.34 U11.13
RECELEC3
  Top 0.102: 5.95,13.79 6.01,13.73 6.84,13.73 6.94,13.64 8.39,13.64 9.06,14.31 9.06,14.56 10.58,16.08
  Top 0.152: ELEC5.1 2.88,17.23 4.57,15.54 4.57,15.17 5.95,13.79 | U11.5 10.03,17.54 10.58,16.99 10.58,16.08
RECELEC4
  Top 0.152: U11.8 9.07,19.24 10.39,19.24 10.94,18.69 10.94,16.01 9.34,14.41 9.34,14.19 8.5,13.36 6.82,13.36 6.73,13.45 5.86,13.45 3.55,15.75 ELEC6.1
RECREF
  Top 0.152: ELEC9.1 1.99,14.21 1.99,11.33 2.66,10.65 3.54,10.65 3.57,10.62 U6.16
REF  (via drill 0.35)
  Top 0.102: U4.2 11.23,14.37 11.23,14.77 11.35,14.89 12.26,14.89 12.58,14.56 12.58,14.14 v12.62,14.11 | U2.2 15.48,14.77 15.65,14.94 16.34,14.94 16.61,15.21 v16.61,15.25 | U5.2 19.31,14.4 19.31,15.05 18.92,15.05 18.8,15.17 18.51,15.17 17.82,15.86 17.82,15.9 v16.93,16.8 | U3.2 23.57,14.39 23.57,14.79 23.69,14.91 24.36,14.91 24.76,14.5 24.76,14.35 v24.85,14.26
  Top 0.152: C7.2 8.18,9.56 R7.2 8.69,11.15 8.28,11.56 v8.28,11.58
  Route2 0.102: 12.76,14.35 13.95,15.55 16.31,15.55 v16.61,15.25 16.93,15.57 v16.93,16.8 17.03,16.9 19.24,14.7 19.24,14.28 20.12,13.4 20.25,13.4 20.29,13.35 21.75,13.35 22.7,14.31 24.81,14.31 v24.85,14.26
  Route2 0.152: 12.76,14.35 12.46,14.35 12.59,14.22 12.59,14.11 | 12.59,14.11 10.76,14.11 9.61,12.96 9.61,12.46 8.74,11.58 v8.28,11.58 | 12.59,14.11 12.59,14.1 v12.61,14.1 v12.62,14.11
S3
  Bottom 0.102: 8.86,8.7 8.89,8.73 8.89,9.74 9.17,10.02 11.92,10.02 11.9,9.99 13.08,9.99 13.29,10.21 U19.12 | C35.2 4.56,15.78 4.63,15.71 4.63,15.05 4.64,15.04 4.64,14.81 7.7,11.74 7.7,9.85 8.86,8.7 | 8.86,8.7 10.3,7.25 11.46,7.25 11.79,6.92 12.66,6.92 13.92,8.19 U19.9
S4  (via drill 0.35)
  Route2 0.152: v21.95,9.08 22.08,9.21 24.38,9.21 24.7,8.89 24.7,8.21 23.87,7.38 21.88,7.38 20.15,5.65 20.15,3.46 19.3,2.61 18.64,2.61 17,0.97 12.72,0.97 9.2,4.49 6.29,4.49 5.23,5.55 5.23,6.6 1.94,9.89 1.94,12.81 4.64,15.51 4.7,15.51 v5.28,16.09
  Bottom 0.102: U19.4 16.88,8.66 16.88,7.83 17.13,7.58 18.52,7.58 18.61,7.67 18.61,10.05 | 18.75,10.05 18.75,10.46 18.61,10.6 17.57,10.6 17.18,10.21 U19.1
  Bottom 0.152: C34.2 5.09,16.51 5.09,16.27 v5.28,16.09 | 18.61,10.05 18.75,10.05 20.91,10.05 21.24,9.72 21.31,9.72 v21.95,9.08
STIM_CS2
  Top 0.102: U16.7 23.62,19.55 24.62,20.55 R35.1
STIMGLITCH  (via drill 0.35, 0.5)
  Top 0.102: U13.3 24.7,9.41 v23.65,8.36
  Top 0.152: U11.15 U11.14 4.99,18.54 v4.85,18.4 | U11.6 U11.7 9.04,18.37 v10.1,18.37 v10.11,18.36 | U6.15 4.16,11.25 3.37,11.25 v3.14,11.48
  Route2 0.102: v23.65,8.36 22.26,8.36 21.65,8.36 19.49,10.51 17.63,10.51 17.05,9.93 11.58,9.93 10.03,11.47 9.56,11.47 8.68,10.6 7.88,10.6 6.68,11.8 6.68,12.03
  Route2 0.152: 10.52,18.36 10.44,18.28 8.94,18.28 7.62,16.95 7.62,15.02 6.59,13.99 | v4.85,18.4 4.88,18.37 10.53,18.37 10.52,18.36 | 10.52,18.36 v10.11,18.36 | v3.14,11.48 3.74,11.48 3.8,11.54 4.1,11.54 6.55,13.99 6.59,13.99 | 6.68,12.03 6.68,13.9 6.59,13.99
TOREC1  (via drill 0.5)
  Top 0.152: v6.24,14.82 6.67,15.24 U11.1 | v10.67,20 11.19,20 11.71,19.47 12.27,19.47 C1.1
  Route2 0.102: 4.92,20.12 6.87,20.12 7.22,19.77 8.3,19.77 8.64,20.1 10.69,20.1 10.69,20.01 v10.67,20
  Route2 0.152: 4.92,20.12 3.9,19.1 3.9,17.94 4.68,17.15 5.71,17.15 6.86,16 6.86,15.44 v6.24,14.82
TOREC2
  Top 0.102: U11.12 6.67,21.29 7.31,21.93 12.08,21.93 14.19,19.83 C2.1
TOREC3  (via drill 0.35, 0.5)
  Top 0.102: C3.1 11.96,17.09 v11.63,17.09
  Top 0.152: U11.4 8.93,16.83 9.14,16.62 v9.57,16.62
  Route2 0.102: v9.57,16.62 11.15,16.62 v11.63,17.09
TOREC4
  Top 0.102: 13.41,18.28 13.41,18.3 | U11.9 9.41,19.74 10.49,20.81 10.99,20.81 11.42,20.38 11.42,20.15 11.83,19.75 12.62,19.75 12.8,19.57 13.28,19.57 13.41,19.43 13.41,18.45 13.41,18.3 | C4.1 13.41,18.3
TOREF
  Top 0.102: U6.1 5,9.72 4.43,9.15 4.43,8.04 5.02,7.45 6.9,7.45 7.58,8.13 7.93,8.13
  Top 0.152: 7.93,8.13 8.14,8.34 C7.1
V01  (via drill 0.35)
  Top 0.102: IC1.1 28.9,11.64 28.68,11.86 28.68,14.89 29.13,15.34 U15.1 28.44,14.69 28.44,14.67 v28.41,14.64 | IC2.4 23.14,23.29 23.72,23.29 24.78,22.23 v24.81,22.23
  Route2 0.102: v28.41,14.64 28.41,14.73 27.48,15.67 27.48,20.75 26,22.23 v24.81,22.23
V02  (via drill 0.35)
  Top 0.102: IC1.7 25.51,12.29 25.15,12.65 25.15,13.65 25.49,13.98 25.49,14.9 25.24,15.16 24.55,15.16 U16.1 24.99,16.07 v25.08,15.98
  Route2 0.102: v15.82,17.59 17.53,17.59 18.36,16.76 19.33,16.76 19.65,17.08 22.25,17.08 22.32,17 22.66,17 22.67,17.01 22.99,17.01 23.31,16.69 24.37,16.69 v25.08,15.98
  Bottom 0.102: v15.82,17.59 16.17,17.94 IC3.4
V-  (via drill 0.35)
  Top 0.102: R28.1 16.8,20.18 U17.1
  Top 0.152: J1.3 25.79,5.91 26.21,5.48 26.41,5.48 26.64,5.71 26.64,6.16 28.1,7.62 v28.1,8.66 | U17.1 17.82,20.43 17.46,20.79 v17.01,20.79
  Route2 0.102: 28.1,8.86 28.14,8.82 28.14,7.58 27.3,6.74 23.08,6.74 v21.52,5.18
  Route2 0.152: v28.1,8.66 28.1,8.86 28.1,8.91 26.38,10.63 25.08,10.63 24.47,11.24 24.47,13.28 24.65,13.46 25.15,13.46 25.67,13.98 25.67,14.81 25.5,14.97 21.71,14.97 21.63,14.89 20.06,14.89 19.18,15.78 v19.18,15.98
  Route15 0.102: v21.52,5.18 21.52,5.19 22.56,6.23 22.56,7.45 20.22,9.79 v17.94,9.79
  Route15 0.152: v28.1,8.66 28.1,8.84 | v17.01,20.79 17.23,20.57 17.23,18.08 19.18,16.13 v19.18,15.98
  Bottom 0.102: R29.1 18.58,23.97 U18.1 | U19.2 16.91,9.79 v17.94,9.79
  Bottom 0.152: U18.1 18.57,23.47 18.93,23.47 19.21,23.2 19.21,22.39 19.47,22.13 20.51,22.13 20.78,21.86 20.78,20.9 20.57,20.69 17.39,20.69 17.29,20.79 v17.01,20.79
VCC  (via drill 0.35)
  Top 0.102: U17.4 19.81,18.8 19.81,18.22 v20,18.03 20,17.33 19.95,17.28 19.68,17.28 R30.2
  Top 0.152: J1.9 24.68,5.16 24.66,5.19 23.95,5.19 23.51,4.75 v23.06,4.75
  Route2 0.152: v20,18.03 20,17.84 19.2,17.04 18.47,17.04 16.51,19 16.51,19.83 16.1,20.24 15.5,20.24 14.71,21.03 14.18,21.03 v14.01,20.85
  Route15 0.152: v20,18.03 20.12,18.03 20.65,18.56 20.65,19.06 20.42,19.29 20.42,19.98 21.12,20.68 21.89,20.68 22.16,20.41 22.16,19.57 22.72,19.01 23,19.01 24.49,20.5 24.89,20.5 25.54,19.84 27.86,19.84 28.52,20.5 30.06,20.5 30.5,20.06 30.5,18.6 30.85,18.25 30.85,17.07 30.81,17.07 29.84,16.1 29.34,16.1 29.17,15.93 29.17,13.93 27.03,11.79 27.03,7.69 26.33,6.99 24.88,6.99 23.46,5.57 23.46,5.15 v23.06,4.75 22.17,4.75 21.53,4.12 18.6,4.12 17.04,5.69 15.98,5.69 15.56,5.27 12.6,5.27 12.04,5.83 12.04,6.47 10.88,7.62 10.88,7.96 v9.7,9.14
  Bottom 0.102: U18.4 15.55,22.42 15.42,22.55 14.78,22.55 14.77,22.54 14.18,22.54 14.08,22.44 | 14.08,22.44 14.02,22.38 | 14.02,22.38 14.02,20.86 v14.01,20.85 | 14.08,22.44 14.07,22.44 R31.2 14.02,22.49 14.02,22.38 | U19.11 13.76,9.55 13.42,9.55 13.05,9.18 13.05,8.97 12.71,8.63 10.21,8.63 v9.7,9.14
  Bottom 0.152: v23.06,4.75 23.07,4.74 23.48,4.74
VDD  (via drill 0.35, 0.5)  (1 unrouted)
  Top 0.102: 19.62,11.23 U5.7 | v20.96,11.24 20.71,11.24 | U13.4 25.39,9.81 v25.9,9.81 | IC4.C3 IC4.P$4 | C40.1 20.49,28.12 C38.1 | 18.54,30.11 18.56,30.13 20.74,30.13 20.79,30.13 20.83,30.09 21.21,29.72 21.32,29.72 | 20.85,28.42 20.84,28.41 20.8,28.41 | v22.82,16.08 22.8,16.07 U16.14
  Top 0.152: U6.11 5.36,12.95 5.36,13.32 5.11,13.57 4.51,13.57 v4.21,13.87 | U4.7 11.21,11.23 11.21,10.67 12.47,9.41 v12.47,9.21 | U2.7 15.61,11.26 15.61,10.82 15.74,10.69 16.78,10.69 v17.25,11.15 | U5.7 19.6,11.26 19.6,10.82 19.73,10.69 20.2,10.69 20.75,11.24 v20.96,11.24 | U3.7 23.55,11.25 23.55,10.81 23.68,10.68 24.16,10.68 25,11.51 v25.91,11.51 26.04,11.64 IC1.8 | U8.8 16.51,4.69 v16.56,4.74 | J1.1 25.97,6.45 25.94,6.48 25.94,7.18 26.27,7.51 v26.27,8.18 | U1.B4 12.66,27.79 12.26,28.18 12.26,28.51 12.39,28.63 12.39,29.58 12.3,29.49 | U14.1 U14.3 21.33,28.66 22.19,27.81 22.82,27.81 23.09,28.08 23.09,28.82 22.29,29.62 21.42,29.62 21.32,29.72 21.15,29.72 20.74,30.13 | C38.1 20.56,28.45 U14.1 | C37.1 15.62,30.19 D1.2 15.78,29.6 15.2,29.02 15.2,28.71 14.84,28.35 13.34,28.35 12.19,29.49 12.3,29.49 | 12.3,29.49 12.33,29.49 v12.55,29.27 | U14.1 20.98,28.59 20.8,28.41 19.72,27.33 19.72,27.05 v19.68,27.01 | IC4.A4 18.18,29.32 18.18,29.75 18.54,30.11 | 20.83,30.09 20.54,30.09 20.47,30.16 18.58,30.16 C41.1 | U16.5 U16.6 24.66,19.34 v24.81,19.5 | U15.5 U15.6 30.15,19.34 v29.74,19.74 | U15.14 27.35,15.1 27.35,14.63 28.07,13.91 28.07,11.97 27.73,11.64 IC1.8 | IC1.8 27.17,11.58 C21.1 27.26,10.53 27.26,9.94 27.54,9.66 C20.1 | v7.76,21.08 7.17,20.48 U11.11 | v11.95,4.85 11.93,4.83 U9.8
  Route2 0.102: IC4.P$4 18.19,28.63 18.19,28.74 18.38,28.93 18.65,28.93 19.68,27.9 v19.68,27.01
  Route15 0.102: 25.91,11.4 25.91,10.45 25.9,10.44 v25.9,9.81 | 22.98,15.91 22.91,15.83 22.91,15.39
  Route15 0.152: 4.2,13.7 4.2,16.91 3.58,17.54 3.58,19.32 4.22,19.96 6.39,19.96 7.51,21.08 v7.76,21.08 | 8,7.6 8,8.4 7.45,8.95 7.45,9.53 9.48,11.56 10.25,11.56 12.08,9.73 12.32,9.73 12.49,9.56 12.47,9.54 12.45,9.54 | 17.05,11.24 v20.96,11.24 24.82,11.24 25.43,11.85 | 8,7.6 7.53,7.13 5.64,7.13 4.27,8.5 4.27,11.95 4.2,12.02 4.2,13.7 | 8,7.6 8.83,6.76 8.83,5.66 9.68,4.81 12.15,4.81 | IC4.C3 IC4.P$4 | v12.55,29.27 12.55,29.13 15.67,26.01 15.67,23.48 15.28,23.1 15.28,22.71 15.38,22.62 15.38,21.6 14.88,21.1 14.88,19.23 15.39,18.72 16.1,18.72 18.11,16.72 18.11,15.77 18.99,14.89 21.63,14.89 22.12,15.39 22.91,15.39 24.35,15.39 24.51,15.23 25.55,15.23 25.92,14.86 | v25.91,11.51 25.91,11.4 25.9,11.39 25.43,11.85 | 25.93,14.85 25.92,14.86 | 25.92,14.86 25.92,14.23 24.92,13.23 24.92,12.37 25.43,11.85 | 24.6,19.54 24.6,16.94 24.41,16.75 23.23,16.75 22.98,16.5 22.98,15.91 22.82,16.07 v22.82,16.08 | v25.9,9.81 26.27,9.44 v26.27,8.18 | 24.6,19.54 24.6,19.62 25.08,19.62 25.16,19.54 27.99,19.54 28.19,19.74 v29.74,19.74 | 17.05,11.24 17.14,11.15 v17.25,11.15 | 24.6,19.54 24.63,19.5 v24.81,19.5 | 12.45,9.54 12.48,9.51 12.48,9.52 12.69,9.73 12.71,9.73 13.26,10.29 14.12,10.29 15.07,11.24 17.05,11.24 | 4.2,13.7 4.21,13.7 v4.21,13.87 | v16.56,4.74 15.52,4.74 15.41,4.85 12.2,4.85 12.15,4.81 | 20.13,27.1 20.04,27.01 v19.68,27.01 | 12.15,4.81 12.1,4.85 v11.95,4.85 | v12.47,9.21 12.47,9.41 12.45,9.43 12.45,9.54
  Bottom 0.152: BATTERY+.1 15.96,29.33 14.99,28.36 13.46,28.36 v12.55,29.27 11.41,29.27 10.89,28.75 8.63,28.75 8.31,28.43 8.31,27.49 9.03,26.77 9.03,25.52 9.44,25.1 9.94,25.1 12.38,27.54 13.96,27.54 15.31,26.19 17.39,26.19 17.72,25.86 18.67,25.86 19.68,26.87 v19.68,27.01
VOUT1
  Top 0.102: IC1.3 29.96,13.16 30.42,13.16 31.28,14.03 31.28,15.45 30.63,16.11 U15.2
VOUT2
  Top 0.102: IC1.5 26.1,14.73 25.98,14.84 25.98,16.13 25.32,16.8 U16.2
VSS  (via drill 0.35, 0.5)
  Top 0.102: U5.4 18.25,14.46 v17.66,14.46 | v30.65,14.35 29.89,13.59 IC1.4 | U9.4 7.64,6.17 v6.35,6.17 | U8.4 12.79,6.74 v12.79,6.15
  Top 0.152: 7.24,16.76 U11.2 7.17,16.24 7.85,15.56 7.85,14.72 v8.17,14.4 | U6.2 5.45,9.86 5.45,8.69 v5.35,8.59 | U4.4 9.6,13.74 9.53,13.74 8.59,12.8 8.8,12.8 v8.7,12.7 v8.69,12.7 | U3.4 21.52,14.23 21.45,14.16 v21.45,14.08 | J1.7 25.23,5.35 25.65,4.93 25.65,4.72 25.2,4.27 24.62,4.27 24.49,4.14 23,4.14 22.6,3.74 v22.29,3.74 | U2.4 14.42,14.24 14.4,14.25 v13.74,14.25
  Route2 0.152: 12.79,6.66 13.45,6 13.45,3.17 13.41,3.13 13.41,2.11 13.55,1.97 14.15,1.97 v14.16,1.97 | v6.35,6.17 6.35,6.5 6.98,7.13 11.19,7.13 11.92,6.41 12.53,6.41 12.78,6.66 12.79,6.66 | 12.79,6.66 v12.79,6.15
  Route15 0.102: v17.66,14.46 17.47,14.27 13.75,14.27 | 30.58,14.42 30.22,14.42
  Route15 0.152: 8.87,13.37 6.8,15.43 | 6.8,15.43 6.8,15.47 | v17.66,14.46 17.95,14.16 21.36,14.16 v21.45,14.08 | v30.65,14.35 30.58,14.42 | 30.22,14.42 27.34,11.54 27.34,7.51 26.35,6.52 25.01,6.52 24.37,5.88 24.37,4.1 24.27,4 23.26,4 23.01,3.74 v22.29,3.74 22.29,2.69 21.88,2.27 21.53,2.27 20.74,1.48 19.73,1.48 19.47,1.73 19.47,1.76 19.03,2.2 | 6.8,15.47 6.86,15.41 6.9,15.41 7.91,14.4 v8.17,14.4 | 6.8,15.47 6.8,16.14 6.97,16.3 6.97,18.36 7.89,19.28 9.64,19.28 9.84,19.48 9.84,20.6 10.04,20.81 10.04,21.65 9.79,21.91 7.42,21.91 6.06,20.55 4.24,20.55 3.23,19.54 3.23,12.56 3.97,11.82 3.97,11.14 3.62,10.78 3.62,8.72 5.28,7.06 5.28,6.85 5.98,6.15 6.01,6.17 v6.35,6.17 | 8.87,13.37 8.69,13.19 v8.69,12.7 | 8.87,13.37 8.88,13.38 9.77,13.38 9.79,13.4 12.26,13.4 12.45,13.2 13.14,13.2 13.68,13.75 13.68,14.2 13.75,14.27 13.74,14.27 v13.74,14.25 | 6.8,15.43 | 6.8,15.43 7.07,15.16 7.07,10.31 v5.35,8.59 | 19.03,2.2 19.02,2.2 18.97,2.15 18.74,2.15 18.72,2.17 14.48,2.17 14.29,1.97 v14.16,1.97 | 19.03,2.2